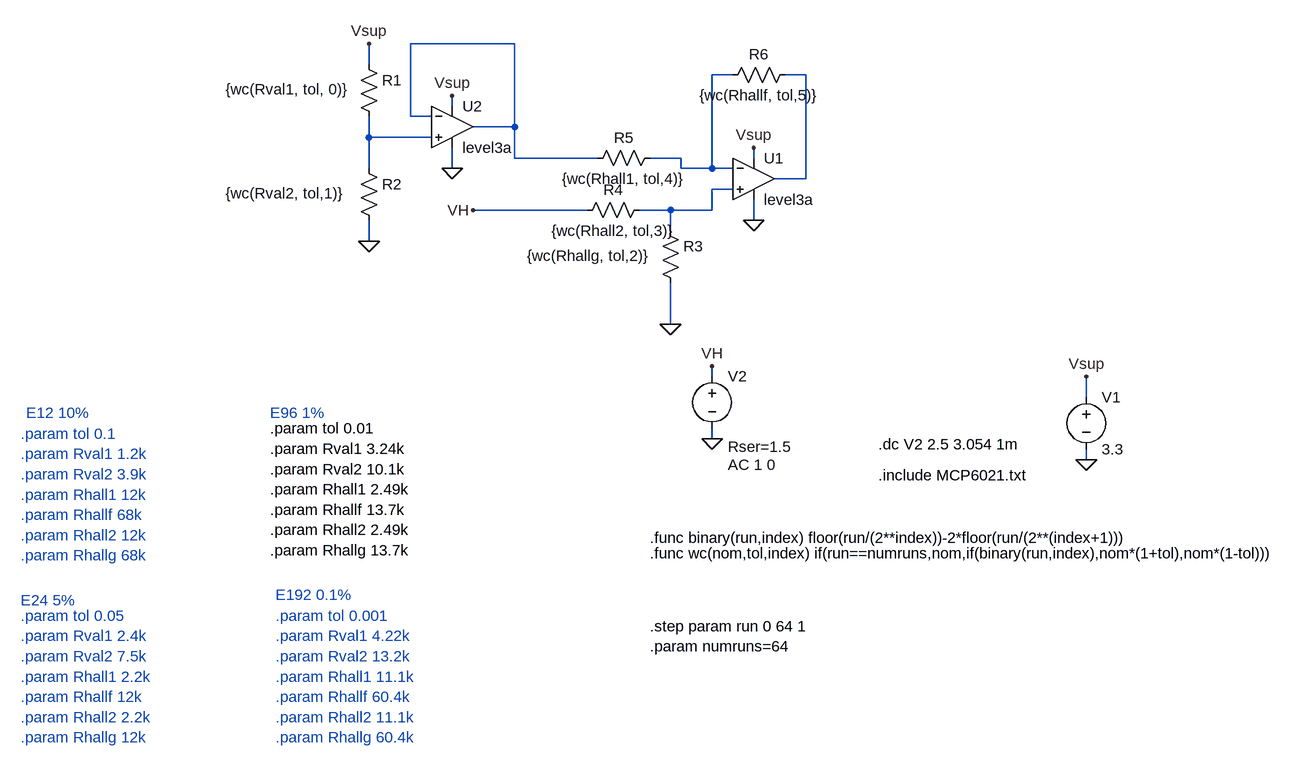
[diagram p0: schematic op_amp_circuitrs.asc]
op_amp_circuitrs.asc, the LTspice schematic file:
Version 4.1
SHEET 1 1300 1128
WIRE -272 -80 -432 -80
WIRE -496 -48 -496 -80
WIRE 64 -32 32 -32
WIRE 176 -32 144 -32
WIRE -368 16 -368 0
WIRE -432 32 -432 -80
WIRE -400 32 -432 32
WIRE -272 48 -272 -80
WIRE -272 48 -336 48
WIRE -496 64 -496 32
WIRE -400 64 -496 64
WIRE -272 96 -272 48
WIRE -144 96 -272 96
WIRE -16 96 -64 96
WIRE 96 96 96 80
WIRE -496 112 -496 64
WIRE -368 112 -368 80
WIRE -16 112 -16 96
WIRE 32 112 32 -32
WIRE 32 112 -16 112
WIRE 64 112 32 112
WIRE 176 128 176 -32
WIRE 176 128 128 128
WIRE 64 144 32 144
WIRE -160 176 -336 176
WIRE -32 176 -80 176
WIRE 32 176 32 144
WIRE 32 176 -32 176
WIRE 96 192 96 160
WIRE -32 208 -32 176
WIRE -496 224 -496 192
WIRE -32 352 -32 288
WIRE 32 432 32 416
WIRE 608 464 608 432
WIRE 32 528 32 512
WIRE 608 560 608 544
FLAG 608 560 0
FLAG 96 192 0
FLAG 32 528 0
FLAG 96 80 Vsup
FLAG 608 432 Vsup
FLAG 32 416 VH
FLAG -32 352 0
FLAG -368 112 0
FLAG -368 0 Vsup
FLAG -496 -80 Vsup
FLAG -496 224 0
FLAG -336 176 VH
SYMBOL voltage 608 448 R0
WINDOW 123 0 0 Left 0
WINDOW 39 0 0 Left 0
SYMATTR InstName V1
SYMATTR Value 3.3
SYMBOL voltage 32 416 R0
WINDOW 3 32 51 Left 2
WINDOW 123 24 152 Left 2
WINDOW 39 24 124 Left 2
SYMATTR Value ""
SYMATTR Value2 AC 1 0
SYMATTR SpiceLine Rser=1.5
SYMATTR InstName V2
SYMBOL res -512 -64 R0
WINDOW 3 -205 54 Left 2
SYMATTR Value {wc(Rval1, tol, 0)}
SYMATTR InstName R1
SYMBOL res -512 96 R0
WINDOW 3 -205 54 Left 2
SYMATTR Value {wc(Rval2, tol,1)}
SYMATTR InstName R2
SYMBOL res -48 192 R0
WINDOW 3 -205 54 Left 2
SYMATTR Value {wc(Rhallg, tol,2)}
SYMATTR InstName R3
SYMBOL res -64 160 R90
WINDOW 0 0 56 VBottom 2
WINDOW 3 32 56 VTop 2
SYMATTR InstName R4
SYMATTR Value {wc(Rhall2, tol,3)}
SYMBOL res -48 80 R90
WINDOW 0 0 56 VBottom 2
WINDOW 3 32 56 VTop 2
SYMATTR InstName R5
SYMATTR Value {wc(Rhall1, tol,4)}
SYMBOL res 160 -48 R90
WINDOW 0 0 56 VBottom 2
WINDOW 3 32 56 VTop 2
SYMATTR InstName R6
SYMATTR Value {wc(Rhallf, tol,5)}
SYMBOL OpAmps\\UniversalOpAmp3 96 128 R0
SYMATTR InstName U1
SYMBOL OpAmps\\UniversalOpAmp3 -368 48 R0
SYMATTR InstName U2
TEXT 288 584 Left 2 !.include MCP6021.txt
TEXT -64 704 Left 2 !.func wc(nom,tol,index) if(run==numruns,nom,if(binary(run,index),nom*(1+tol),nom*(1-tol)))
TEXT -64 680 Left 2 !.func binary(run,index) floor(run/(2**index))-2*floor(run/(2**(index+1)))
TEXT -1032 520 Left 2 ;.param tol 0.1\n.param Rval1 1.2k\n.param Rval2 3.9k\n.param Rhall1 12k\n.param Rhallf 68k\n.param Rhall2 12k\n.param Rhallg 68k
TEXT -1032 800 Left 2 ;.param tol 0.05\n.param Rval1 2.4k\n.param Rval2 7.5k\n.param Rhall1 2.2k\n.param Rhallf 12k\n.param Rhall2 2.2k\n.param Rhallg 12k
TEXT -648 512 Left 2 !.param tol 0.01\n.param Rval1 3.24k\n.param Rval2 10.1k\n.param Rhall1 2.49k\n.param Rhallf 13.7k\n.param Rhall2 2.49k\n.param Rhallg 13.7k
TEXT -640 800 Left 2 ;.param tol 0.001\n.param Rval1 4.22k\n.param Rval2 13.2k\n.param Rhall1 11.1k\n.param Rhallf 60.4k\n.param Rhall2 11.1k\n.param Rhallg 60.4k
TEXT -1024 488 Left 2 ;E12 10%
TEXT -1032 776 Left 2 ;E24 5%
TEXT -648 488 Left 2 ;E96 1%
TEXT -640 768 Left 2 ;E192 0.1%
TEXT -64 816 Left 2 !.step param run 0 64 1\n.param numruns=64
TEXT 288 536 Left 2 !.dc V2 2.5 3.054 1m

The netlist it stands for:
* op_amp_circuitrs.asc
V1 Vsup 0 3.3
V2 VH 0 AC 1 0 Rser=1.5
R1 Vsup N004 {wc(Rval1, tol, 0)}
R2 N004 0 {wc(Rval2, tol,1)}
R3 N005 0 {wc(Rhallg, tol,2)}
R4 N005 VH {wc(Rhall2, tol,3)}
R5 N002 N001 {wc(Rhall1, tol,4)}
R6 N003 N002 {wc(Rhallf, tol,5)}
X§U1 N005 N002 Vsup 0 N003 level3a  ; pins In+ In- V+ V- OUT
X§U2 N004 N001 Vsup 0 N001 level3a  ; pins In+ In- V+ V- OUT
.include MCP6021.txt
.func wc(nom,tol,index) if(run==numruns,nom,if(binary(run,index),nom*(1+tol),nom*(1-tol)))
.func binary(run,index) floor(run/(2**index))-2*floor(run/(2**(index+1)))
* .param tol 0.1
* .param Rval1 1.2k
* .param Rval2 3.9k
* .param Rhall1 12k
* .param Rhallf 68k
* .param Rhall2 12k
* .param Rhallg 68k
* .param tol 0.05
* .param Rval1 2.4k
* .param Rval2 7.5k
* .param Rhall1 2.2k
* .param Rhallf 12k
* .param Rhall2 2.2k
* .param Rhallg 12k
.param tol 0.01
.param Rval1 3.24k
.param Rval2 10.1k
.param Rhall1 2.49k
.param Rhallf 13.7k
.param Rhall2 2.49k
.param Rhallg 13.7k
* .param tol 0.001
* .param Rval1 4.22k
* .param Rval2 13.2k
* .param Rhall1 11.1k
* .param Rhallf 60.4k
* .param Rhall2 11.1k
* .param Rhallg 60.4k
* E12 10%
* E24 5%
* E96 1%
* E192 0.1%
.step param run 0 64 1
.param numruns=64
.dc V2 2.5 3.054 1m
.backanno
.end